# Altium schematic sheet mxvr.1.SchDoc
size 558 x 431 mm
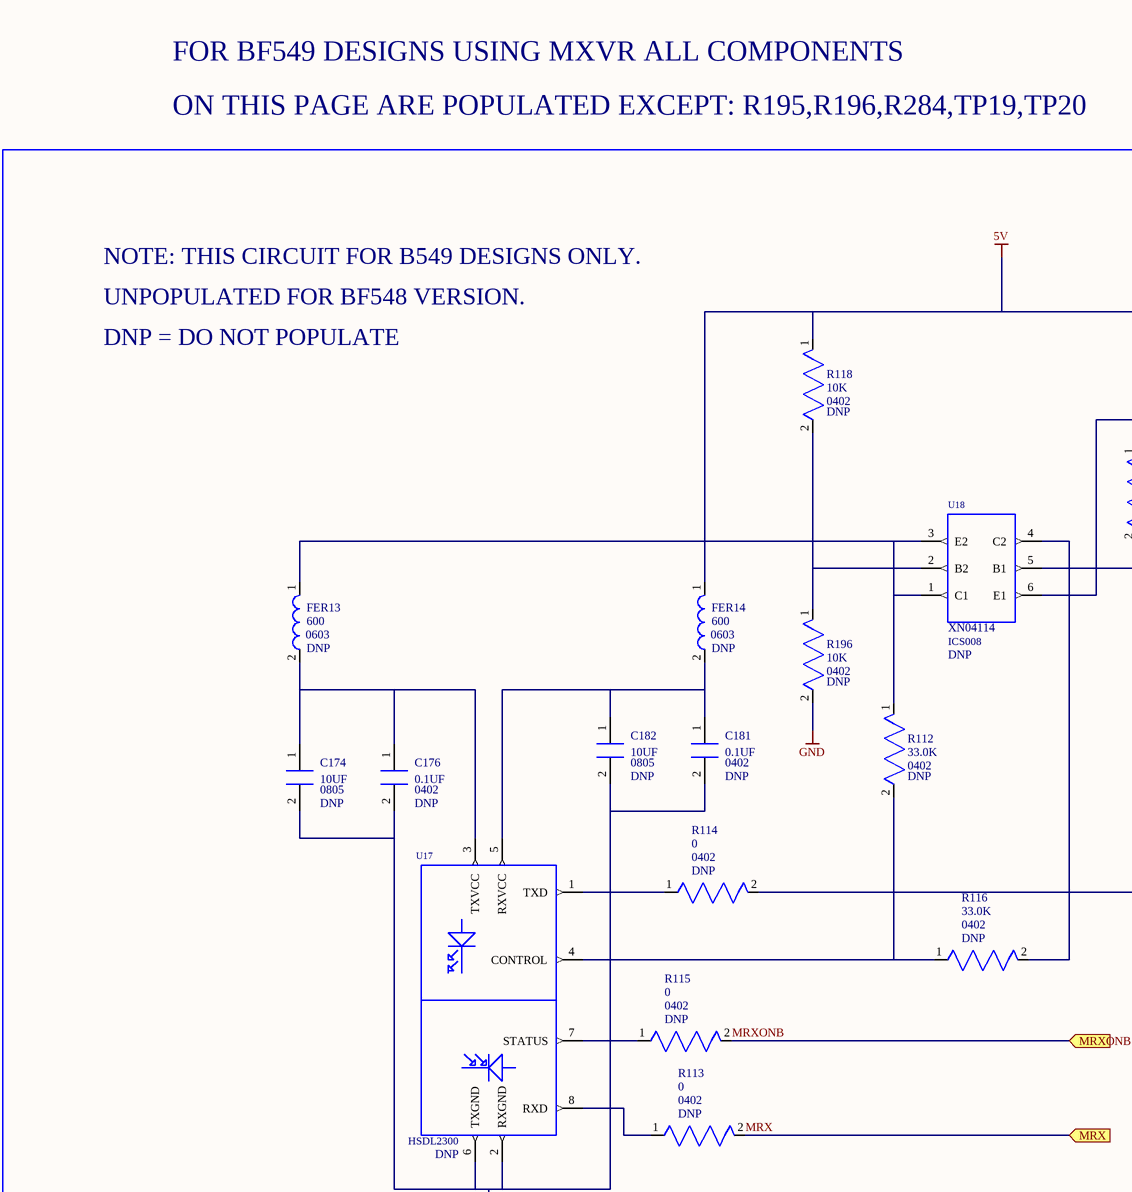
[diagram p0: mxvr.1.SchDoc, top left]
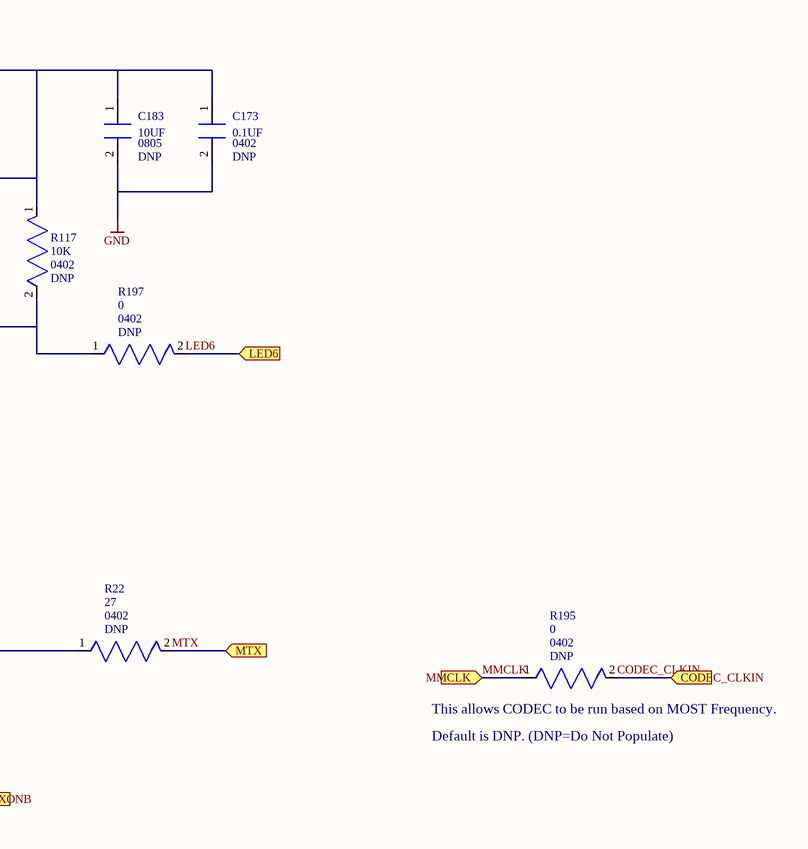
[diagram p1: mxvr.1.SchDoc, top right]
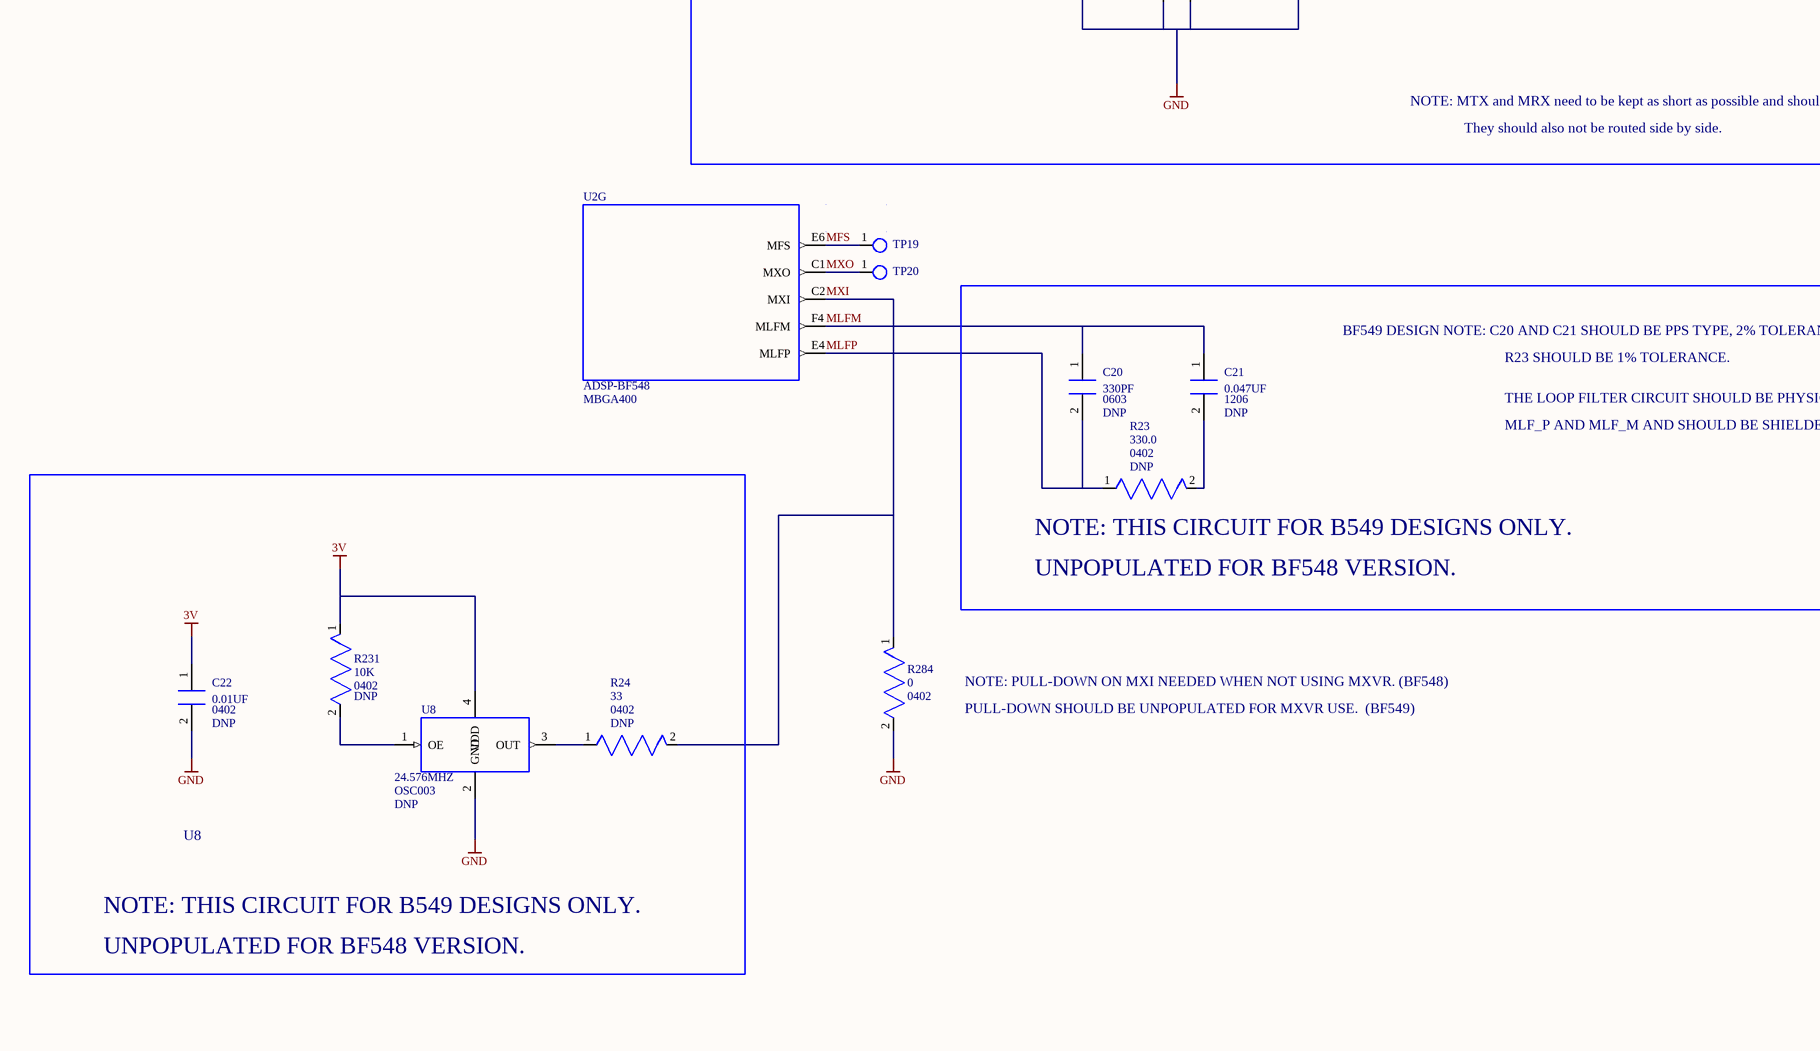
[diagram p2: mxvr.1.SchDoc, bottom left]
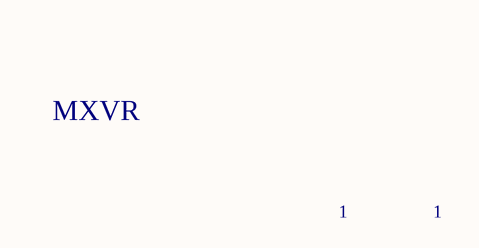
[diagram p3: mxvr.1.SchDoc, bottom right]

## Parts
C20  value 330PF  CLASS: DNP  [0603]  (hidden comment: *)
C21  value 0.047UF  CLASS: DNP  [1206]  (hidden comment: *)
C22  value 0.01UF  CLASS: DNP  [0402]  (hidden comment: *)
C173  value 0.1UF  CLASS: DNP  [0402]  (hidden comment: *)
C174  value 10UF  CLASS: DNP  [0805]  (hidden comment: *)
C176  value 0.1UF  CLASS: DNP  [0402]  (hidden comment: *)
C181  value 0.1UF  CLASS: DNP  [0402]  (hidden comment: *)
C182  value 10UF  CLASS: DNP  [0805]  (hidden comment: *)
C183  value 10UF  CLASS: DNP  [0805]  (hidden comment: *)
FER13  value 600  CLASS: DNP  [0603]  (hidden comment: *)
FER14  value 600  CLASS: DNP  [0603]  (hidden comment: *)
R22  value 27  CLASS: DNP  [0402]  (hidden comment: *)
R23  value 330.0  CLASS: DNP  [0402]  (hidden comment: *)
R24  value 33  CLASS: DNP  [0402]  (hidden comment: *)
R112  value 33.0K  CLASS: DNP  [0402]  (hidden comment: *)
R113  value 0  CLASS: DNP  [0402]  (hidden comment: *)
R114  value 0  CLASS: DNP  [0402]  (hidden comment: *)
R115  value 0  CLASS: DNP  [0402]  (hidden comment: *)
R116  value 33.0K  CLASS: DNP  [0402]  (hidden comment: *)
R117  value 10K  CLASS: DNP  [0402]  (hidden comment: *)
R118  value 10K  CLASS: DNP  [0402]  (hidden comment: *)
R195  value 0  CLASS: DNP  [0402]  (hidden comment: *)
R196  value 10K  CLASS: DNP  [0402]  (hidden comment: *)
R197  value 0  CLASS: DNP  [0402]  (hidden comment: *)
R231  value 10K  CLASS: DNP  [0402]  (hidden comment: *)
R284  value 0  [0402]  (hidden comment: *)
TP19  *  [TP]  (value not drawn)
TP20  *  [TP]  (value not drawn)
U2  PART: ADSP-BF548  PKG_TYPE: MBGA400  (hidden comment: ICS_ADSPBF548)  (part G of 7)
U8  value 24.576MHZ  CLASS: DNP  [OSC003]  (hidden comment: *)
U17  CLASS: DNP  [HSDL2300]  (hidden comment: SPF_MOX_003)
U18  PART: XN04114  CLASS: DNP  [ICS008]  (hidden comment: *)

## Ports
CODEC_CLKIN, LED6, MMCLK, MRX, MRXONB, MTX

## Nets
3V: C22.1(A) R231.1(N1) U8.4(VDD)
5V: C173.1(A) C183.1(A) FER14.1(A) R117.1(N1) R118.1(N1) U18.6(E1)
GND: C22.2(B) C173.2(B) C174.2(B) C176.2(B) C181.2(B) C182.2(B) C183.2(B) R196.2(N2) R284.2(N2) U8.2(GND) U17.2(RXGND) U17.6(TXGND)
CODEC_CLKIN: R195.2(N2) ; port CODEC_CLKIN
LED6: R197.2(N2) ; port LED6
MFS: TP19.1(TP) U2.E6(MFS)
MLFM: C20.1(A) C21.1(A) U2.F4(MLFM)
MLFP: C20.2(B) R23.1(N1) U2.E4(MLFP)
MMCLK: R195.1(N1) ; port MMCLK
MRX: R113.2(N2) ; port MRX
MRXONB: R115.2(N2) ; port MRXONB
MTX: R22.2(N2) ; port MTX
MXI: R24.2(N2) R284.1(N1) U2.C2(MXI)
MXO: TP20.1(TP) U2.C1(MXO)
NetC21_2: C21.2(B) R23.2(N2)
NetC174_1: C174.1(A) C176.1(A) FER13.2(B) U17.3(TXVCC)
NetC181_1: C181.1(A) C182.1(A) FER14.2(B) U17.5(RXVCC)
NetFER13_1: FER13.1(A) R112.1(N1) U18.1(C1) U18.3(E2)
NetR22_1: R22.1(N1) R114.2(N2)
NetR24_1: R24.1(N1) U8.3(OUT)
NetR112_2: R112.2(N2) R116.1(N1) U17.4(CONTROL)
NetR113_1: R113.1(N1) U17.8(RXD)
NetR114_1: R114.1(N1) U17.1(TXD)
NetR115_1: R115.1(N1) U17.7(STATUS)
NetR116_2: R116.2(N2) U18.4(C2)
NetR117_2: R117.2(N2) R197.1(N1) U18.5(B1)
NetR118_2: R118.2(N2) R196.1(N1) U18.2(B2)
NetR231_2: R231.2(N2) U8.1(OE)

## Notes on the sheet
- FOR BF549 DESIGNS USING MXVR ALL COMPONENTS
- ON THIS PAGE ARE POPULATED EXCEPT: R195,R196,R284,TP19,TP20
- NOTE: THIS CIRCUIT FOR B549 DESIGNS ONLY.
- UNPOPULATED FOR BF548 VERSION.
- DNP = DO NOT POPULATE
- (near R195) This allows CODEC to be run based on MOST Frequency.
- (near R195) Default is DNP. (DNP=Do Not Populate)
- NOTE: MTX and MRX need to be kept as short as possible and should be shielded.
- They should also not be routed side by side.
- BF549 DESIGN NOTE: C20 AND C21 SHOULD BE PPS TYPE, 2% TOLERANCE.
- R23 SHOULD BE 1% TOLERANCE.
- THE LOOP FILTER CIRCUIT SHOULD BE PHYSICALLY CLOSE TO
- MLF_P AND MLF_M AND SHOULD BE SHIELDED USING GNDMP.
- (near R23) NOTE: THIS CIRCUIT FOR B549 DESIGNS ONLY.
- NOTE: PULL-DOWN ON MXI NEEDED WHEN NOT USING MXVR. (BF548)
- PULL-DOWN SHOULD BE UNPOPULATED FOR MXVR USE.  (BF549)
- U8
- MXVR
- 1
- A
- B
- C
- D
- 2
- 3
- 20 Cotton Road
- 4
- DEVICES
- ANALOG
- Nashua, NH 03063
- PH: 1-800-ANALOGD
- Title
- ADSP-BF548 EZ-KIT LITE
- Size
- Board No.
- A0206-2006
- Rev
- 1.4B
- Date
- Sheet
- of

## Library data of the parts
C20 = CAP_NON_POLARIZED.2: PART_SPEC: CAPACITOR; LEVEL: STD; PRT_NUM: 7000577; TYPE: PPS; VOLTAGE: 16V; TOLERANCE: 2%; PKG_TYPE: 0603; ROHS: ROHS
C21 = CAP_NON_POLARIZED.2: PART_SPEC: CAPACITOR; LEVEL: STD; PRT_NUM: 7000578; TYPE: PPS; VOLTAGE: 16V; TOLERANCE: 2%; PKG_TYPE: 1206; ROHS: ROHS
C22 = CAP_NON_POLARIZED.2: PART_SPEC: CAPACITOR; LEVEL: STD; PRT_NUM: 7000279; VOLTAGE: 16V; TOLERANCE: 10%; BOARDS: BOTH; TYPE: X7R; PKG_TYPE: 0402; ROHS: ROHS
C173 C181 = CAP_NON_POLARIZED.2: PART_SPEC: CAPACITOR; LEVEL: STD; PRT_NUM: 7000278; TYPE: X5R; VOLTAGE: 10V; TOLERANCE: 10%; PKG_TYPE: 0402; ROHS: ROHS
C174 C183 = CAP_NON_POLARIZED.2: PART_SPEC: CAPACITOR; LEVEL: STD; TOLERANCE: 10%; VOLTAGE: 10V; TYPE: X5R CER; PRT_NUM: 7000461; PKG_TYPE: 0805; ROHS: ROHS
C176 = CAP_NON_POLARIZED.2: PART_SPEC: CAPACITOR; LEVEL: STD; TOLERANCE: 10%; VOLTAGE: 10V; TYPE: X5R; PRT_NUM: 7000278; PKG_TYPE: 0402; ROHS: ROHS
C182 = CAP_NON_POLARIZED.2: PART_SPEC: CAPACITOR; LEVEL: STD; PRT_NUM: 7000461; TYPE: X5R CER; VOLTAGE: 10V; TOLERANCE: 10%; PKG_TYPE: 0805; ROHS: ROHS
FER13 = FER_STANDARD.2: PART_SPEC: FERRITE; LEVEL: STD; CURRENT: 200MA; FREQ: 100MHZ; PRT_NUM: 7000112; PKG_TYPE: 0603; ROHS: ROHS
FER14 = FER_STANDARD.2: PART_SPEC: FERRITE; LEVEL: STD; PRT_NUM: 7000112; FREQ: 100MHZ; CURRENT: 200MA; PKG_TYPE: 0603; ROHS: ROHS
R22 = RES_STANDARD.1: PART_SPEC: RESISTOR; LEVEL: STD; PRT_NUM: 7000579; TOLERANCE: 5%; BOARDS: BOTH; POWER: 1/16W; PKG_TYPE: 0402; ROHS: ROHS
R23 = RES_STANDARD.1: PART_SPEC: RESISTOR; LEVEL: STD; PRT_NUM: 7000565; POWER: 1/16W; TOLERANCE: 1%; PKG_TYPE: 0402; ROHS: ROHS
R24 = RES_STANDARD.1: PART_SPEC: RESISTOR; LEVEL: STD; PRT_NUM: 7000285; TOLERANCE: 5%; BOARDS: BOTH; POWER: 1/16W; PKG_TYPE: 0402; ROHS: ROHS
R112 = RES_STANDARD.2: PART_SPEC: RESISTOR; LEVEL: STD; TOLERANCE: 1%; POWER: 1/16W; PRT_NUM: 7000566; PKG_TYPE: 0402; ROHS: ROHS
R113 R115 R195 = RES_STANDARD.1: PART_SPEC: RESISTOR; LEVEL: STD; TOLERANCE: 5%; POWER: 1/16W; PRT_NUM: 7000282; PKG_TYPE: 0402; ROHS: ROHS
R114 R197 = RES_STANDARD.1: PART_SPEC: RESISTOR; LEVEL: STD; PRT_NUM: 7000282; POWER: 1/16W; TOLERANCE: 5%; PKG_TYPE: 0402; ROHS: ROHS
R116 = RES_STANDARD.1: PART_SPEC: RESISTOR; LEVEL: STD; PRT_NUM: 7000566; POWER: 1/16W; TOLERANCE: 1%; PKG_TYPE: 0402; ROHS: ROHS
R117 R231 = RES_STANDARD.2: PART_SPEC: RESISTOR; LEVEL: STD; PRT_NUM: 7000280; TOLERANCE: 5%; BOARDS: BOTH; POWER: 1/16W; PKG_TYPE: 0402; ROHS: ROHS
R118 = RES_STANDARD.2: PART_SPEC: RESISTOR; LEVEL: STD; PRT_NUM: 7000280; POWER: 1/16W; TOLERANCE: 5%; PKG_TYPE: 0402; ROHS: ROHS
R196 = RES_STANDARD.2: PART_SPEC: RESISTOR; LEVEL: STD; TOLERANCE: 5%; POWER: 1/16W; PRT_NUM: 7000280; PKG_TYPE: 0402; ROHS: ROHS
R284 = RES_STANDARD.2: PART_SPEC: RESISTOR; LEVEL: STD; POWER: 1/16W; BOARDS: BOTH; TOLERANCE: 5%; PRT_NUM: 7000282; PKG_TYPE: 0402; ROHS: ROHS
TP19 TP20 = MSC_TEST_POINT.2: TESTPOINT; CLASS: DNP; LEVEL: STD; PART_SPEC: TESTPOINT; PART: TESTPOINT; ROHS: ROHS; PKG_TYPE: TP
U2 = ICS_ADSPBF548_A: 600 MHZ; LEVEL: MXVR; PRT_NUM: 30-025548-02; DEVICE: ICS_ADSPBF548; ROHS: ROHS; WEB: http://www.analog.com/en/prod/0,2877,ADSP%252DBF548,00.html
U8 = OSC_SMT_OE.2: OSCILLATOR; LEVEL: MXVR; PRT_NUM: 1000340; PART_SPEC: OSCILLATOR; PKG_TYPE: OSC003; ROHS: ROHS
U17 = CON_MOST.1: LEVEL: STD; PRT_NUM: 6000848; DEVICE: SPF_MOX_003; PKG_TYPE: HSDL2300
U18 = ICS_XN4114.1: DUAL PNP; LEVEL: STD; PRT_NUM: 1000425; PKG_TYPE: ICS008; ROHS: ROHS; WEB: http://www.semicon.panasonic.co.jp/ds/eng/SJJ00047BED.pdf